# Altium schematic sheet Power.SchDoc
size A3; SheetNumber: 7; SheetTotal: 8
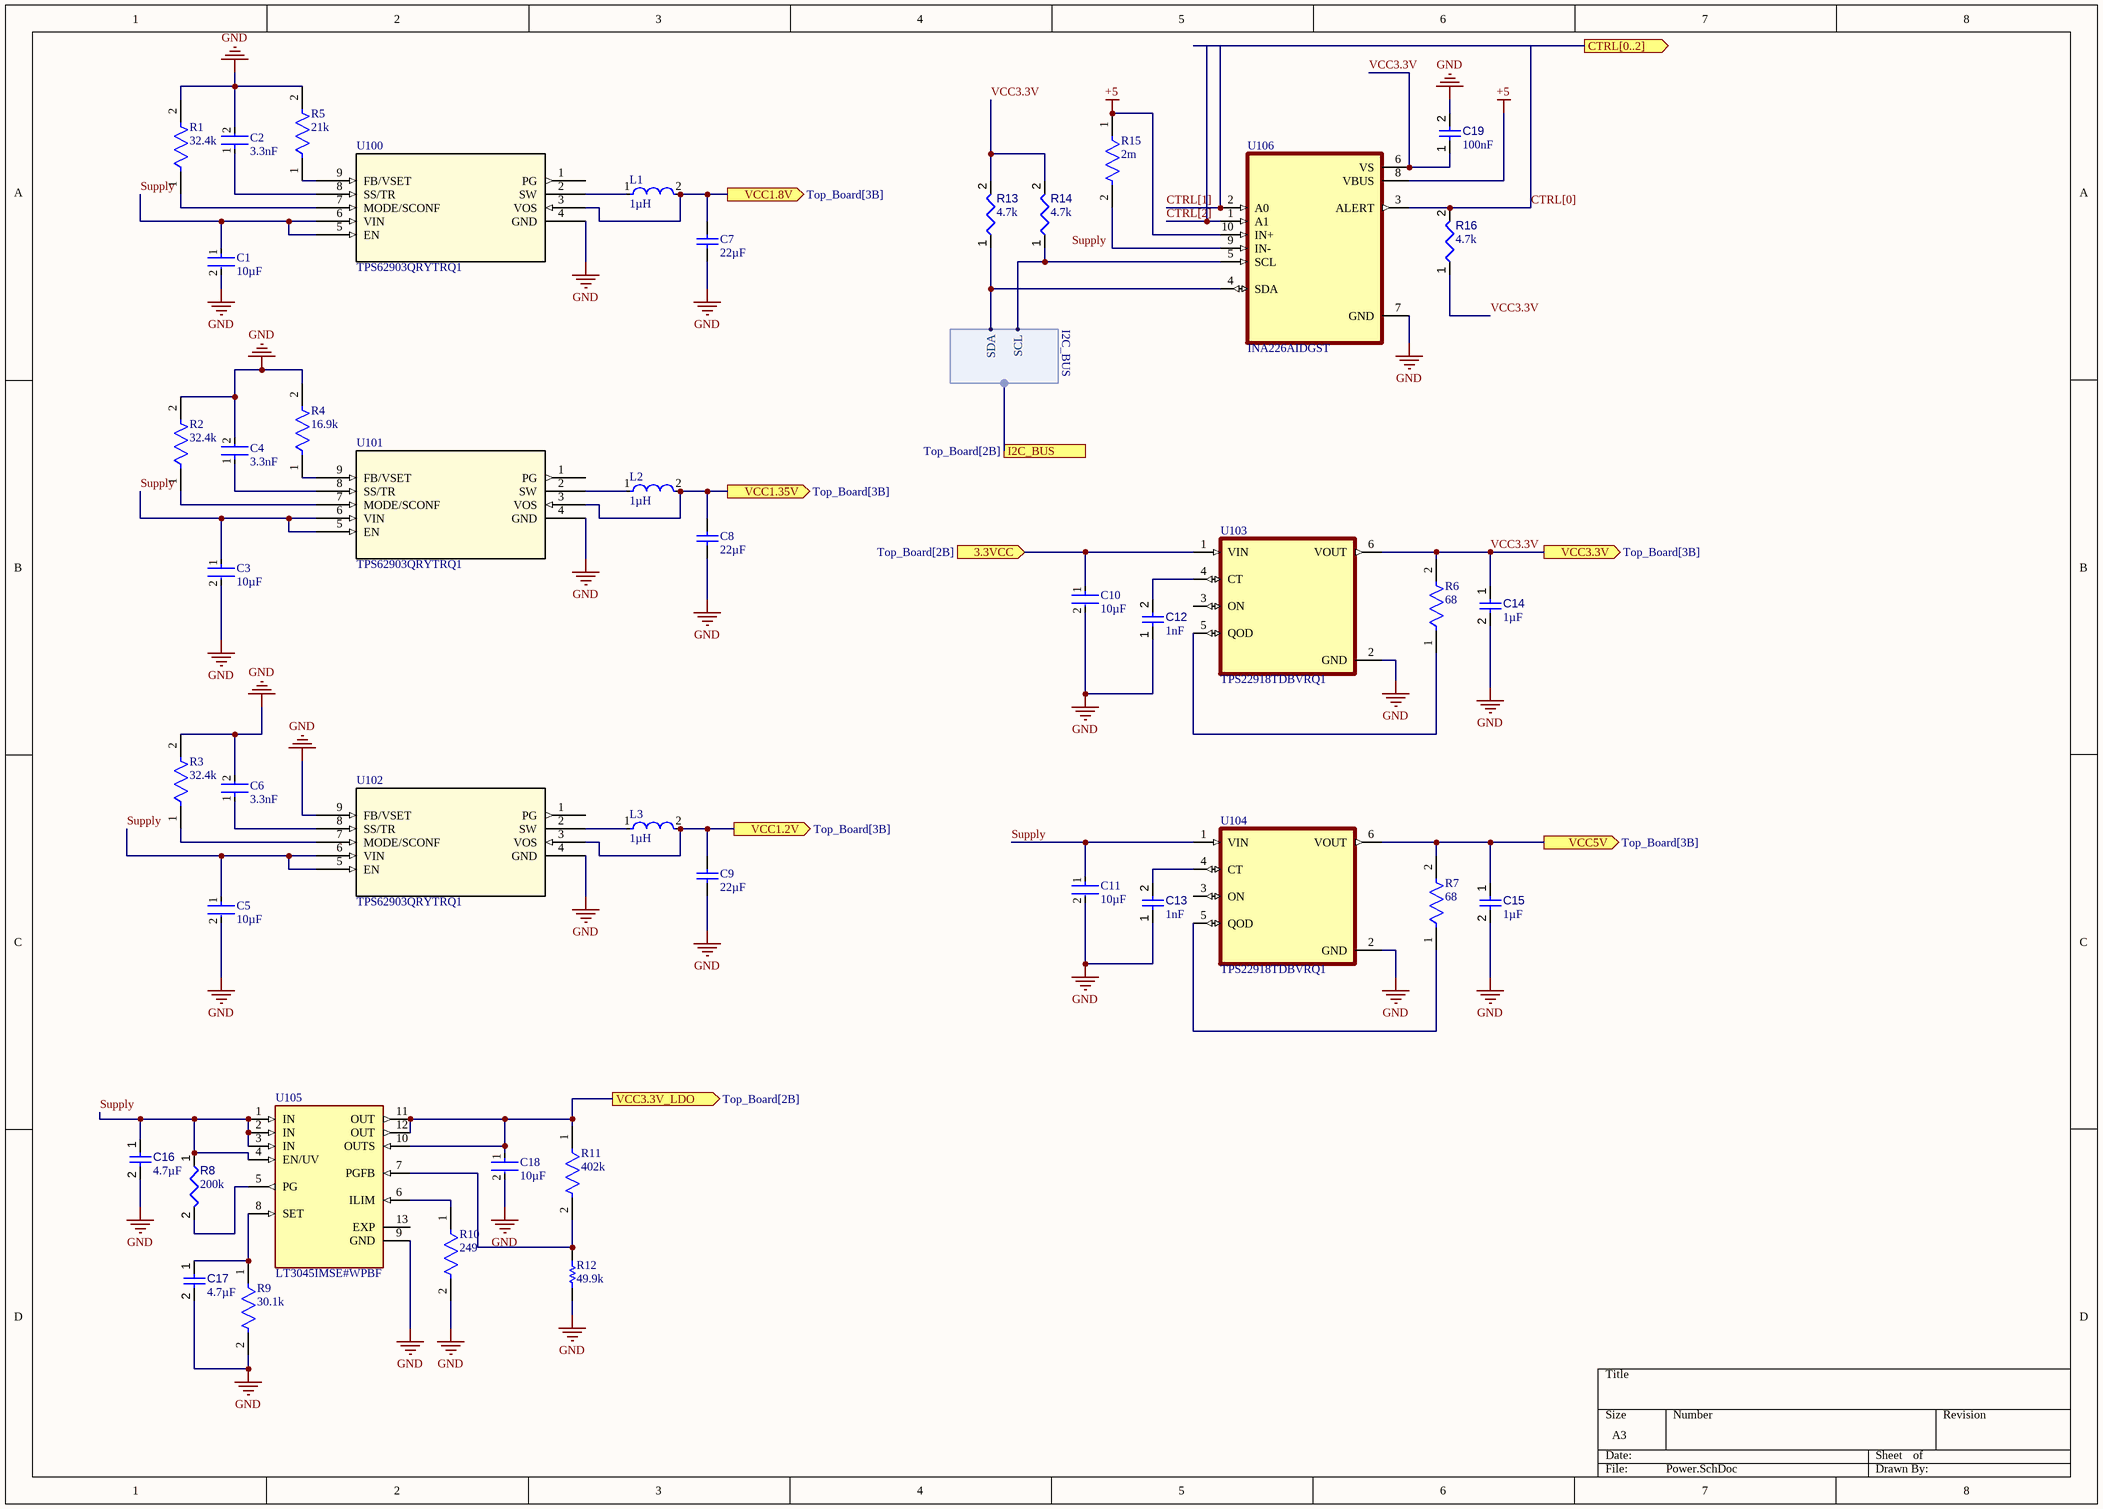
[diagram p0: Power.SchDoc]

## Parts
C1  value 10µF  [FP-C0805C106K3PACTU-IPC_C]  (hidden comment: cap 10uf 25v 0805)
C2  value 3.3nF  [FP-C0603C-CF-IPC_B]  (hidden comment: cap 3.3nF 0603 16v)
C3  value 10µF  [FP-C0805C106K3PACTU-IPC_C]  (hidden comment: cap 10uf 25v 0805)
C4  value 3.3nF  [FP-C0603C-CF-IPC_B]  (hidden comment: cap 3.3nF 0603 16v)
C5  value 10µF  [FP-C0805C106K3PACTU-IPC_C]  (hidden comment: cap 10uf 25v 0805)
C6  value 3.3nF  [FP-C0603C-CF-IPC_B]  (hidden comment: cap 3.3nF 0603 16v)
C7  value 22µF  [CAPC0805(2012)145_N]  (hidden comment: cap 22uf 0805)
C8  value 22µF  [CAPC0805(2012)145_N]  (hidden comment: cap 22uf 0805)
C9  value 22µF  [CAPC0805(2012)145_N]  (hidden comment: cap 22uf 0805)
C10  value 10µF  [FP-C0805C106K3PACTU-IPC_C]  (hidden comment: cap 10uf 25v 0805)
C11  value 10µF  [FP-C0805C106K3PACTU-IPC_C]  (hidden comment: cap 10uf 25v 0805)
C12  value 1nF  [CAPC0402(1005)33_L]  (hidden comment: Capacitor 1nF +/-20% 50V 0402)
C13  value 1nF  [CAPC0402(1005)33_L]  (hidden comment: Capacitor 1nF +/-20% 50V 0402)
C14  value 1µF  [CAPC2013X135X45NL10T25]  (hidden comment: Capacitor 1 uF +/- 10% 50 V 0805)
C15  value 1µF  [CAPC2013X135X45NL10T25]  (hidden comment: Capacitor 1 uF +/- 10% 50 V 0805)
C16  value 4.7µF  [CAPC0805(2012)145_L]  (hidden comment: Capacitor 4.7µF +/-40% 25V 0805)
C17  value 4.7µF  [CAPC0805(2012)145_L]  (hidden comment: Capacitor 4.7µF +/-40% 25V 0805)
C18  value 10µF  [FP-C0805C106K3PACTU-IPC_C]  (hidden comment: cap 10uf 25v 0805)
C19  value 100nF  [CAPC2013X95X50LL10T25]  (hidden comment: Capacitor 100 nF +/-10% 50 V 0805)
L1  value 1µH  [FP-LB2016-1_6-0_2-IPC_A]  (hidden comment: ind 1uH)
L2  value 1µH  [FP-LB2016-1_6-0_2-IPC_A]  (hidden comment: ind 1uH)
L3  value 1µH  [FP-LB2016-1_6-0_2-IPC_A]  (hidden comment: ind 1uH)
R1  value 32.4k  [FP-RK73H2A-IPC_C]  (hidden comment: RES 32.4K 0805)
R2  value 32.4k  [FP-RK73H2A-IPC_C]  (hidden comment: RES 32.4K 0805)
R3  value 32.4k  [FP-RK73H2A-IPC_C]  (hidden comment: RES 32.4K 0805)
R4  value 16.9k  [FP-AC0805-IPC_A]  (hidden comment: 16.9k 0805)
R5  value 21k  [FP-RT0805-MFG]  (hidden comment: res 21k 0805)
R6  value 68  [FP-RMCF0805-MFG]  (hidden comment: 68 0805)
R7  value 68  [FP-RMCF0805-MFG]  (hidden comment: 68 0805)
R8  value 200k  [RESC0402(1005)_L]  (hidden comment: Resistor 200K +/-1 % 0402 63 mW)
R9  value 30.1k  [FP-ERJ3EK-IPC_A]  (hidden comment: res 30.1k 0603)
R10  value 249  [FP-RT0603-IPC_C]  (hidden comment: res 249 0603)
R11  value 402k  [FP-AC0805-IPC_A]  (hidden comment: res 402k 0805)
R12  value 49.9k  [RESC0603X26X15NL03T05]  (hidden comment: res 49.9k)
R13  value 4.7k  [RESC2013X70X40ML20T20]  (hidden comment: Resistor 4k7 +/-1% 0805 125 mW)
R14  value 4.7k  [RESC2013X70X40ML20T20]  (hidden comment: Resistor 4k7 +/-1% 0805 125 mW)
R15  value 2m  [FP-CSR0603-IPC_B]  (hidden comment: res 0.02 0603)
R16  value 4.7k  [RESC2013X70X40ML20T20]  (hidden comment: Resistor 4k7 +/-1% 0805 125 mW)
U100  TPS62903QRYTRQ1  [VQFNHR9_RYT_TEX]
U101  TPS62903QRYTRQ1  [VQFNHR9_RYT_TEX]
U102  TPS62903QRYTRQ1  [VQFNHR9_RYT_TEX]
U103  TPS22918TDBVRQ1  [SOT95P280X145-6N]
U104  TPS22918TDBVRQ1  [SOT95P280X145-6N]
U105  LT3045IMSE#WPBF  [SOP65P490X110-13N]
U106  INA226AIDGST  [SOP50P490X110-10N]

## Ports
3.3VCC (in, see Top_Board[2B]), CTRL[0..2] (out), I2C_BUS (harness I2C_BUS, see Top_Board[2B]), VCC1.2V (out, see Top_Board[3B]), VCC1.8V (out, see Top_Board[3B]), VCC1.35V (out, see Top_Board[3B]), VCC3.3V (out, see Top_Board[3B]), VCC3.3V_LDO (out, see Top_Board[2B]), VCC5V (out, see Top_Board[3B])

## Harnesses
I2C_BUS: SDA, SCL

## Nets
+5: R15.1 U106.8(VBUS) U106.10(IN+)
GND: C1.2 C2.2 C3.2 C4.2 C5.2 C6.2 C7.1 C8.1 C9.1 C10.2 C11.2 C12.1 C13.1 C14.2 C15.2 C16.2 C17.2 C18.2 C19.2 R1.2 R2.2 R3.2 R4.2 R5.2 R9.2 R10.2 R12.2 U100.4(GND) U101.4(GND) U102.4(GND) U102.9(FB/VSET) U103.2(GND) U104.2(GND) U105.9(GND) U106.7(GND)
3.3VCC: C10.1 U103.1(VIN) ; port 3.3VCC
CTRL[0]: R16.2 U106.3(ALERT)
CTRL[1]: U106.2(A0)
CTRL[2]: U106.1(A1)
Supply: C1.1 C3.1 C5.1 C11.1 C16.1 R8.1 U100.5(EN) U100.6(VIN) U101.5(EN) U101.6(VIN) U102.5(EN) U102.6(VIN) U104.1(VIN) U105.1(IN) U105.2(IN) U105.3(IN) U105.4(EN/UV)
VCC1.2V: C9.2 L3.2 U102.3(VOS) ; port VCC1.2V
VCC1.8V: C7.2 L1.2 U100.3(VOS) ; port VCC1.8V
VCC1.35V: C8.2 L2.2 U101.3(VOS) ; port VCC1.35V
VCC3.3V: C14.1 C19.1 R6.2 R13.2 R14.2 R16.1 U103.6(VOUT) U106.6(VS) ; port VCC3.3V
VCC3.3V_LDO: C18.1 R11.1 U105.10(OUTS) U105.11(OUT) U105.12(OUT) ; port VCC3.3V_LDO
VCC5V: C15.1 R7.2 U104.6(VOUT) ; port VCC5V
NetC2_1: C2.1 U100.8(SS/TR)
NetC4_1: C4.1 U101.8(SS/TR)
NetC6_1: C6.1 U102.8(SS/TR)
NetC12_2: C12.2 U103.4(CT)
NetC13_2: C13.2 U104.4(CT)
NetC17_1: C17.1 R9.1 U105.8(SET)
NetL1_1: L1.1 U100.2(SW)
NetL2_1: L2.1 U101.2(SW)
NetL3_1: L3.1 U102.2(SW)
NetR1_1: R1.1 U100.7(MODE/SCONF)
NetR2_1: R2.1 U101.7(MODE/SCONF)
NetR3_1: R3.1 U102.7(MODE/SCONF)
NetR4_1: R4.1 U101.9(FB/VSET)
NetR5_1: R5.1 U100.9(FB/VSET)
NetR6_1: R6.1 U103.5(QOD)
NetR7_1: R7.1 U104.5(QOD)
NetR8_2: R8.2 U105.5(PG)
NetR10_1: R10.1 U105.6(ILIM)
NetR11_2: R11.2 R12.1 U105.7(PGFB)
NetR13_1: R13.1 U106.4(SDA) ; harness I2C_BUS.SDA
NetR14_1: R14.1 U106.5(SCL) ; harness I2C_BUS.SCL
NetR15_2: R15.2 U106.9(IN-)

Not connected (* = marked no-connect by the designer): U100 1(PG); U101 1(PG); U102 1(PG); U103 3(ON); U104 3(ON); U105 13(EXP)

## Notes on the sheet
- Labels drawn without touching a wire or pin: Supply

## Library data of the parts
C1 C3 C5 C10 C11 C18 = CMP-001-00093-1: 0805 C 10UF Ceramic Multilayer Capacitor, 25 VDC, +85DEGC, X5R Dielec, +/-10%; Dissipation Factor: 10%; Width: 1.25mm; REACH SVHC: Unaffected; Mounting Technology: Surface Mount; Depth: 1.25mm; Dielectric: X5R; Number of Terminals: 2; Min Operating Temperature: -55°C; Packaging: Cut Tape; Lead Free: Lead Free; Voltage Rating (DC): 25V; Dielectric Material: Ceramic; Lifecycle Status: Production; Max Operating Temperature: 85°C; Country of Origin: Mexico; Case/Package: 0805; Introduction Date: 2015-10-21; Height: 1.25mm; China RoHS: Compliant; RoHS: Compliant; Case Code (Imperial): 0805; Export Control Classification Number (ECCN) Code: EAR99; Voltage: 25V; Schedule B: 8532240020; Harmonized Tariff Schedule (HTS) Code: 8532.24.00.20; Material: Ceramic; Tolerance: 10%; Length: 2mm; Voltage Rating: 25V; Case Code (Metric): 2012; Termination: Solder
C2 C4 C6 = CMP-001-00094-1: Ceramic Capacitor, Multilayer, Ceramic, 16V, 5% +Tol, 5% -Tol, X7R, 15% TC, 0.0033uF, Surface Mount, 0603; Temperature Coefficient: 30ppm/°C; Export Control Classification Number (ECCN) Code: EAR99; Dielectric Material: Ceramic; Introduction Date: 2012-06-13; Width: 800µm; RoHS: Compliant; Height: 800µm; Country of Origin: Mexico; Lifecycle Status: Production; Material: Ceramic; Voltage Rating: 16V; Harmonized Tariff Schedule (HTS) Code: 8532.24.00.20; Min Operating Temperature: -55°C; Dielectric: X7R; China RoHS: Compliant; Ratings: AEC-Q200; Mounting Technology: Surface Mount; Number of Terminals: 2; Max Operating Temperature: 125°C; Voltage Rating (DC): 16V; Length: 1.6mm; REACH SVHC: Unaffected; Case/Package: 0603
C7-C9 = CMP-001-00095-1: 0805 C0805C 22UF Ceramic Multilayer Capacitor, 6.3V, +85C, X5R Dielectric, +/-10%; Tolerance: 10%; Dissipation Factor: 12%; Contact Material: Tin; Voltage Rating: 6.3V; RoHS: Compliant; Number of Terminals: 2; Max Operating Temperature: 85°C; Voltage Rating (DC): 6.3V; Voltage: 6.3V; Case Code (Imperial): 0805; Lead Free: Lead Free; Min Operating Temperature: -55°C; Width: 1.25mm; Lifecycle Status: Production; Length: 2mm; Export Control Classification Number (ECCN) Code: EAR99; Packaging: Cut Tape; Case Code (Metric): 2012; Termination: SMD/SMT; REACH SVHC: Unaffected; Dielectric: X5R; Case/Package: 0805; Introduction Date: 2008-06-04; Dielectric Material: Ceramic; Depth: 1.25mm; Height: 1.25mm; Harmonized Tariff Schedule (HTS) Code: 8532.24.00.20; China RoHS: Compliant; Schedule B: 8532240020, 8532240020; Country of Origin: Mexico; Mounting Technology: Surface Mount
C12 C13 = CMP-001-00066-3: Chip Capacitor, 1nF +/-20%, 50V, 0402, Thickness 0.33 mm; Tolerance: 10%; Case/Package: 0402; Pins: 2; Min Operating Temperature: -55°C; Max Operating Temperature: 85°C; Voltage Rating: 50V; Mounting Technology: SMT
C14 C15 = CMP-001-00007-6: Chip Capacitor, 1 uF, +/- 10%, 50 V, 0805 (2012 Metric); Capacitor Type: Ceramic; Voltage Rating: 50V; Min Operating Temperature: -55°C; RoHS Compliant: True; Mounting Technology: SM; Case/Package: 0805; Max Operating Temperature: 125°C; Tolerance: 10%; Pins: 2
C16 C17 = CMP-001-00080-4: Chip Capacitor, 4.7µF +/-40%, 25V, 0805, Thickness 1.45 mm; Tolerance: 20%; Voltage Rating: 25V; Min Operating Temperature: -55°C; Max Operating Temperature: 85°C; Pins: 2; Mounting Technology: SMT; Case/Package: 0805
C19 = CMP-001-00018-6: Chip Capacitor, 100 nF, +/- 10%, 50 V, 0805 (2012 Metric); Capacitor Type: Ceramic; Voltage Rating: 50V; Pins: 2; Max Operating Temperature: 125°C; Min Operating Temperature: -55°C; Mounting Technology: SM; Case/Package: 0805; RoHS Compliant: True; Tolerance: 10%
L1-L3 = CMP-006-00021-1: Inductor General Purpose Chip Wirewound 1uH 20% 7.96MHz Ferrite 0.69A 0.13Ohm DCR 0806 T/R; Max Current Rating: 690mA; Number of Circuits: 1; ESR: 130mΩ; Self Resonant Frequency: 100MHz; Shielding: Unshielded; REACH SVHC: Unaffected; Composition: Wirewound; Termination: SMD/SMT; Max DC Current: 690mA; Min Width: 1.4mm; Core Material: Ferrite; Depth: 1.8mm; Case/Package: 0806; Max Operating Temperature: 105°C; Current Rating: 690mA; RoHS: Compliant; Schedule B: 8504500000, 8504500000; Test Frequency: 7.96MHz; DC Current: 690mA; Radiation Hardening: No; Max Width: 1.8mm; Halogen Free: Halogen Free; Case Code (Metric): 2016; Pins: 2; Length: 2mm; Lead Pitch: 1mm; Height - Seated (Max): 1.8034mm; Max Length: 2.2mm; Case Code (Imperial): 0806; Packaging: Tape & Reel (TR); Tolerance: 20%; Lead Free: Lead Free; China RoHS: Compliant; Military Standard: Not; Height: 1.6mm; Number of Terminals: 2; Min Operating Temperature: -40°C; RMS Current (Irms): 690mA; Lifecycle Status: Production; Min Length: 1.8mm; Width: 1.6mm; Mounting Technology: Surface Mount; DC Resistance (DCR): 130mΩ
R1-R3 = CMP-009-00187-1: Fixed Resistor, Metal Glaze/thick Film, 0.25W, 32400ohm, 150V, 0.5% +/-Tol, 100ppm/Cel, Surface Mount, 0805; Power Rating: 250mW; Temperature Coefficient: 100ppm/°C; Working Voltage: 150V; Lifecycle Status: Production; REACH SVHC: Unaffected; Length: 2mm; Width: 1.25mm; Composition: Thick Film; Ratings: AEC-Q200; Mounting Technology: Surface Mount; Height: 500µm; Country of Origin: Japan; China RoHS: Non-Compliant; Case/Package: 0805; Voltage Rating: 150V; Max Operating Temperature: 155°C; RoHS: Compliant; Lead Free: Lead Free; Number of Terminals: 2; Min Operating Temperature: -55°C; Export Control Classification Number (ECCN) Code: EAR99; Tolerance: 0.5%; Introduction Date: 2004-09-15; Harmonized Tariff Schedule (HTS) Code: 8533.21.00.30
R4 = CMP-009-00188-1: Fixed Resistor, Metal Glaze/Thick Film, 0.125W, 16900ohm, 150V, 1% +/-Tol, Surface Mount, 0805; Max Power Dissipation: 125mW; Temperature Coefficient: 100ppm/°C; Export Control Classification Number (ECCN) Code: EAR99; Packaging: Tape & Reel; Length: 2mm; Min Operating Temperature: -55°C; China RoHS: Non-Compliant; Features: Automotive AEC-Q200, Moisture Resistant; Mounting Technology: Surface Mount; Width: 1.25mm; Tolerance: 1%; Number of Terminations: 2; Voltage Rating: 150V; Case/Package: 0805; REACH SVHC: Unaffected; Harmonized Tariff Schedule (HTS) Code: 8533.21.00.30; Composition: Thick Film; Working Voltage: 150V; Number of Terminals: 2; Max Operating Temperature: 155°C; Ratings: AEC-Q200; Country of Origin: Mainland China, Taiwan; Introduction Date: 2012-04-10; Lifecycle Status: Production; Power Rating: 125mW; RoHS: Compliant; Height: 500µm
R5 = CMP-009-00189-1: 125mW Thin Film Resistor 150V ±0.5% ±25ppm/℃ 21kΩ 0805 Chip Resistor - Surface Mount ROHS; Manufacturer Package Identifier: 0805 (2012 metric); Temperature Coefficient: 25ppm/°C; Composition: Thin Film; Mounting Technology: Surface Mount; Max Power Dissipation: 125mW; Lead Free: Lead Free; Min Operating Temperature: -55°C; Number of Terminals: 2; Power Rating: 125mW; Number of Terminations: 2; Max Operating Temperature: 155°C; Case Code (Metric): 0805; Voltage Rating: 150V; Lifecycle Status: Production; Case/Package: 0805; Voltage Rating (DC): 150V; Working Voltage: 150V; Height: 500µm; Packaging: Tape & Reel (TR); RoHS: Compliant; China RoHS: Non-Compliant; Tolerance: 0.5%; Width: 1.25mm; Length: 2mm; REACH SVHC: Unaffected
R6 R7 = CMP-009-00190-1: Res Thick Film 0805 68 Ohm 5% 0.125W(1/8W) ±200ppm/C Pad SMD T/R Automotive AEC-Q200; Manufacturer Package Identifier: 0805 (2012 metric); Working Voltage: 150V; Power Rating: 125mW; Temperature Coefficient: 100ppm/°C; Mounting Technology: Surface Mount; RoHS: Compliant; Height: 500µm; Packaging: Tape & Reel (TR); Case Code (Metric): 2012; Radiation Hardening: No; Voltage Rating: 150V; China RoHS: Non-Compliant; Composition: Thick Film; Schedule B: 8533210045, 8533210045; Max Power Dissipation: 125mW; Lifecycle Status: Production; Features: Automotive AEC-Q200; Case Code (Imperial): 0805; Width: 1.25mm; REACH SVHC: Unaffected; Lead Free: Lead Free; Number of Terminations: 2; Min Operating Temperature: -55°C; Depth: 1.25mm; Number of Terminals: 2; Military Standard: Not; Contact Plating: Tin; Case/Package: 0805; Tolerance: 5%; Ratings: AEC-Q200; Max Operating Temperature: 155°C; Length: 2mm
R8 = CMP-009-00163-3: Chip Resistor, 200 kOhms, +/-1 %, 63 mW, -55 to 155 degC, 0402; Power: 63mW; Tolerance: 1%; Min Operating Temperature: -55°C; Max Operating Temperature: 155°C; Case/Package: 0402; Pins: 2
R9 = CMP-009-00194-1: Res Thick Film 0603 30.1K Ohm 1% 0.1W(1/10W) ±100ppm/C Pad SMD Automotive T/R; Part Series: Precision Thick Film Chip Resistors; Manufacturer Lifecycle Status: ACTIVE; Power Rating: 100mW; Working Voltage: 75V; Temperature Coefficient: 100ppm/°C; Min Operating Temperature: -55°C; Max Power Dissipation: 100mW; Max Operating Temperature: 155°C; REACH SVHC: Unaffected; Lifecycle Status: Production; Contact Plating: Tin; Radiation Hardening: No; Mounting Technology: Surface Mount; Composition: Thick Film; Width: 800µm; Features: Automotive AEC-Q200; Termination: SMD/SMT; Depth: 800µm; Case/Package: 0603; RoHS: Compliant; Case Code (Imperial): 0603; Height: 450µm; Ratings: AEC-Q200; China RoHS: Non-Compliant; Tolerance: 1%; Number of Terminations: 2; Length: 1.6mm; Military Standard: Not; Number of Terminals: 2; Schedule B: 8533210045, 8533210045; Voltage Rating: 75V
R10 = CMP-009-00197-1: 100mW Thin Film Resistor 75V ±25ppm/℃ ±0.1% 249Ω 0603 Chip Resistor - Surface Mount ROHS; Temperature Coefficient: 25ppm/°C; Voltage Rating (DC): 50V; Case Code (Imperial): 0603; RoHS: Compliant; Max Operating Temperature: 155°C; Country of Origin: Mainland China, Taiwan; Mounting Technology: Surface Mount; Export Control Classification Number (ECCN) Code: EAR99; Introduction Date: 2008-06-09; Number of Terminations: 2; REACH SVHC: Unaffected; Tolerance: 0.1%; Depth: 800µm; Schedule B: 8533210045, 8533210045; Lifecycle Status: Production; Number of Terminals: 2; Working Voltage: 75V; Max Power Dissipation: 100mW; Radiation Hardening: No; Harmonized Tariff Schedule (HTS) Code: 8533.21.00.30; Military Standard: Not; Power Rating: 100mW; Height: 450µm; Contact Plating: Tin; Voltage Rating: 75V; Width: 800µm; Case/Package: 0603; Composition: Thin Film; China RoHS: Non-Compliant; Length: 1.6mm; Features: Moisture Resistant; Lead Free: Lead Free; Min Operating Temperature: -55°C; Termination: SMD/SMT
R11 = CMP-009-00195-1: Fixed Resistor, Metal Glaze/Thick Film, 0.125W, 402000ohm, 150V, 1% +/-Tol, Surface Mount, 0805; Manufacturer Package Identifier: 0805 (2012 metric); Power Rating: 125mW; Temperature Coefficient: 100ppm/°C; Tolerance: 1%; Working Voltage: 150V; Ratings: AEC-Q200; Number of Terminations: 2; Max Operating Temperature: 155°C; Width: 1.25mm; Case Code (Metric): 2012; Case Code (Imperial): 0805; Mounting Technology: Surface Mount; Composition: Thick Film; Case/Package: 0805; Max Power Dissipation: 125mW; REACH SVHC: Unaffected; Lifecycle Status: Production; Min Operating Temperature: -55°C; RoHS: Compliant; Height: 500µm; Features: Automotive AEC-Q200, Moisture Resistant; Number of Terminals: 2; Length: 2mm; Export Control Classification Number (ECCN) Code: EAR99; China RoHS: Non-Compliant; Introduction Date: 2012-04-10; Harmonized Tariff Schedule (HTS) Code: 8533.21.00.30; Packaging: Tape & Reel; Termination: SMD/SMT; Voltage Rating: 150V; Country of Origin: Mainland China, Taiwan
R12 = CMP-009-00196-1: Res Thick Film 0201 49.9K Ohm 1% 1/20W ±200ppm/°C Molded SMD SMD T/R; Manufacturer Lifecycle Status: ACTIVE; Part Series: Precision Thick Film Chip Resistors; Max Power Dissipation: 50mW; Voltage Rating: 25V; REACH SVHC: Unaffected; Radiation Hardening: No; Lifecycle Status: Production; Max Operating Temperature: 125°C; RoHS: Compliant; Case Code (Imperial): 0201; Composition: Thick Film; Lead Free: Lead Free; Working Voltage: 25V; Case/Package: 0201; Power Rating: 50mW; Tolerance: 1%; Termination: SMD/SMT; Mounting Technology: Surface Mount; Schedule B: 8533210045, 8533210045; Number of Terminations: 2; Temperature Coefficient: 200ppm/°C; Number of Terminals: 2; Length: 600µm; Min Operating Temperature: -55°C; Contact Plating: Tin; Case Code (Metric): 0603; Height: 230µm; Width: 300µm
R13 R14 R16 = CMP-009-00032-5: Chip Resistor, 4.7 KOhm, +/- 1%, 0.125 W, -55 to 155 degC, 0805 (2012 Metric); Power: 125mW; Voltage Rating: 150V; Max Operating Temperature: 155°C; Min Operating Temperature: -55°C; Case/Package: 0805; RoHS Compliant: True; Pins: 2; Tolerance: 1%; Mounting Technology: SM
R15 = CMP-009-00198-1: Res Thick Film 0603 0.02 Ohm 1% 0.125W ±300ppm/°C Molded SMD Paper T/R; Power Rating: 125mW; Working Voltage: 50mV; Temperature Coefficient: 300ppm/°C; Lead Free: Lead Free; Tolerance: 1%; Mounting Technology: Surface Mount; REACH SVHC: Unaffected; Packaging: Tape & Reel (TR); Case Code (Metric): 1608; Length: 1.6mm; Case/Package: 0603; Number of Terminations: 2; Height: 450µm; Min Operating Temperature: -55°C; Composition: Thick Film; Case Code (Imperial): 0603; RoHS: Compliant; Lifecycle Status: Production; Number of Terminals: 2; Schedule B: 8533210045, 8533210045; China RoHS: Non-Compliant; Width: 800µm; Max Power Dissipation: 125mW; Max Operating Temperature: 155°C
U100-U102 = CMP-063-000000-1: Automotive, 3-V to 18-V, 3-A low-IQ synchronous buck converter with 165Â°C junction temperature 9-VQFN-HR -40 to 165; Manufacturer_Name: Texas Instruments; RefDes: RefDes; Source: TPS62903QRYTRQ1.SchLib; Type: Power Management; Design Item ID: TPS62903QRYTRQ1; Copyright: Copyright (C) 2026 Ultra Librarian. All rights reserved.; Manufacturer_Part_Number: TPS62903QRYTRQ1
U103 U104 = CMP-011-00013-1: 1-ch, 5.5-V, 2-A, 52-mÎ© automotive load switch with adj. rise time and adj. output discharg; MF: Texas Instruments; SnapEDA_Link: https://www.snapeda.com/parts/TPS22918TDBVRQ1/Texas+Instruments/view-part/?ref=snap; Source: TPS22918TDBVRQ1.SchLib; Pins: 6; Component Type: Standard; Value: *; Design Item ID: TPS22918TDBVRQ1; Case/Package: SOT-23-6 Texas Instruments; Check_prices: https://www.snapeda.com/parts/TPS22918TDBVRQ1/Texas+Instruments/view-part/?ref=eda; MP: TPS22918TDBVRQ1
U105 = CMP-055-000000-1: 20V, 500mA, Ultralow Noise, Ultrahigh PSRR Linear Regulator; MF: Analog Devices; SnapEDA_Link: https://www.snapeda.com/parts/LT3045IMSE%23WPBF/Analog+Devices/view-part/?ref=snap; Design Item ID: LT3045IMSE#WPBF; Package: MSOP -12 Analog Devices; Pin Count: 13; Value: *; MP: LT3045IMSE#WPBF; Component Type: Standard; Source: LT3045IMSE#WPBF.SchLib; Check_prices: https://www.snapeda.com/parts/LT3045IMSE%23WPBF/Analog+Devices/view-part/?ref=eda
U106 = CMP-052-000000-1: 36V, 16-bit, ultra-precise i2c output current/voltage/power monitor w/alert; MF: Texas Instruments; Design Item ID: INA226AIDGST; MP: INA226AIDGST; Check_prices: https://www.snapeda.com/parts/INA226AIDGST/Texas+Instruments/view-part/?ref=eda; Component Type: Standard; SnapEDA_Link: https://www.snapeda.com/parts/INA226AIDGST/Texas+Instruments/view-part/?ref=snap; Pin Count: 10; Package: VSSOP-10 Texas Instruments; Value: *; Source: INA226AIDGST.SchLib